# EasyEDA Pro project satelitesbol.eprj, board PCB6
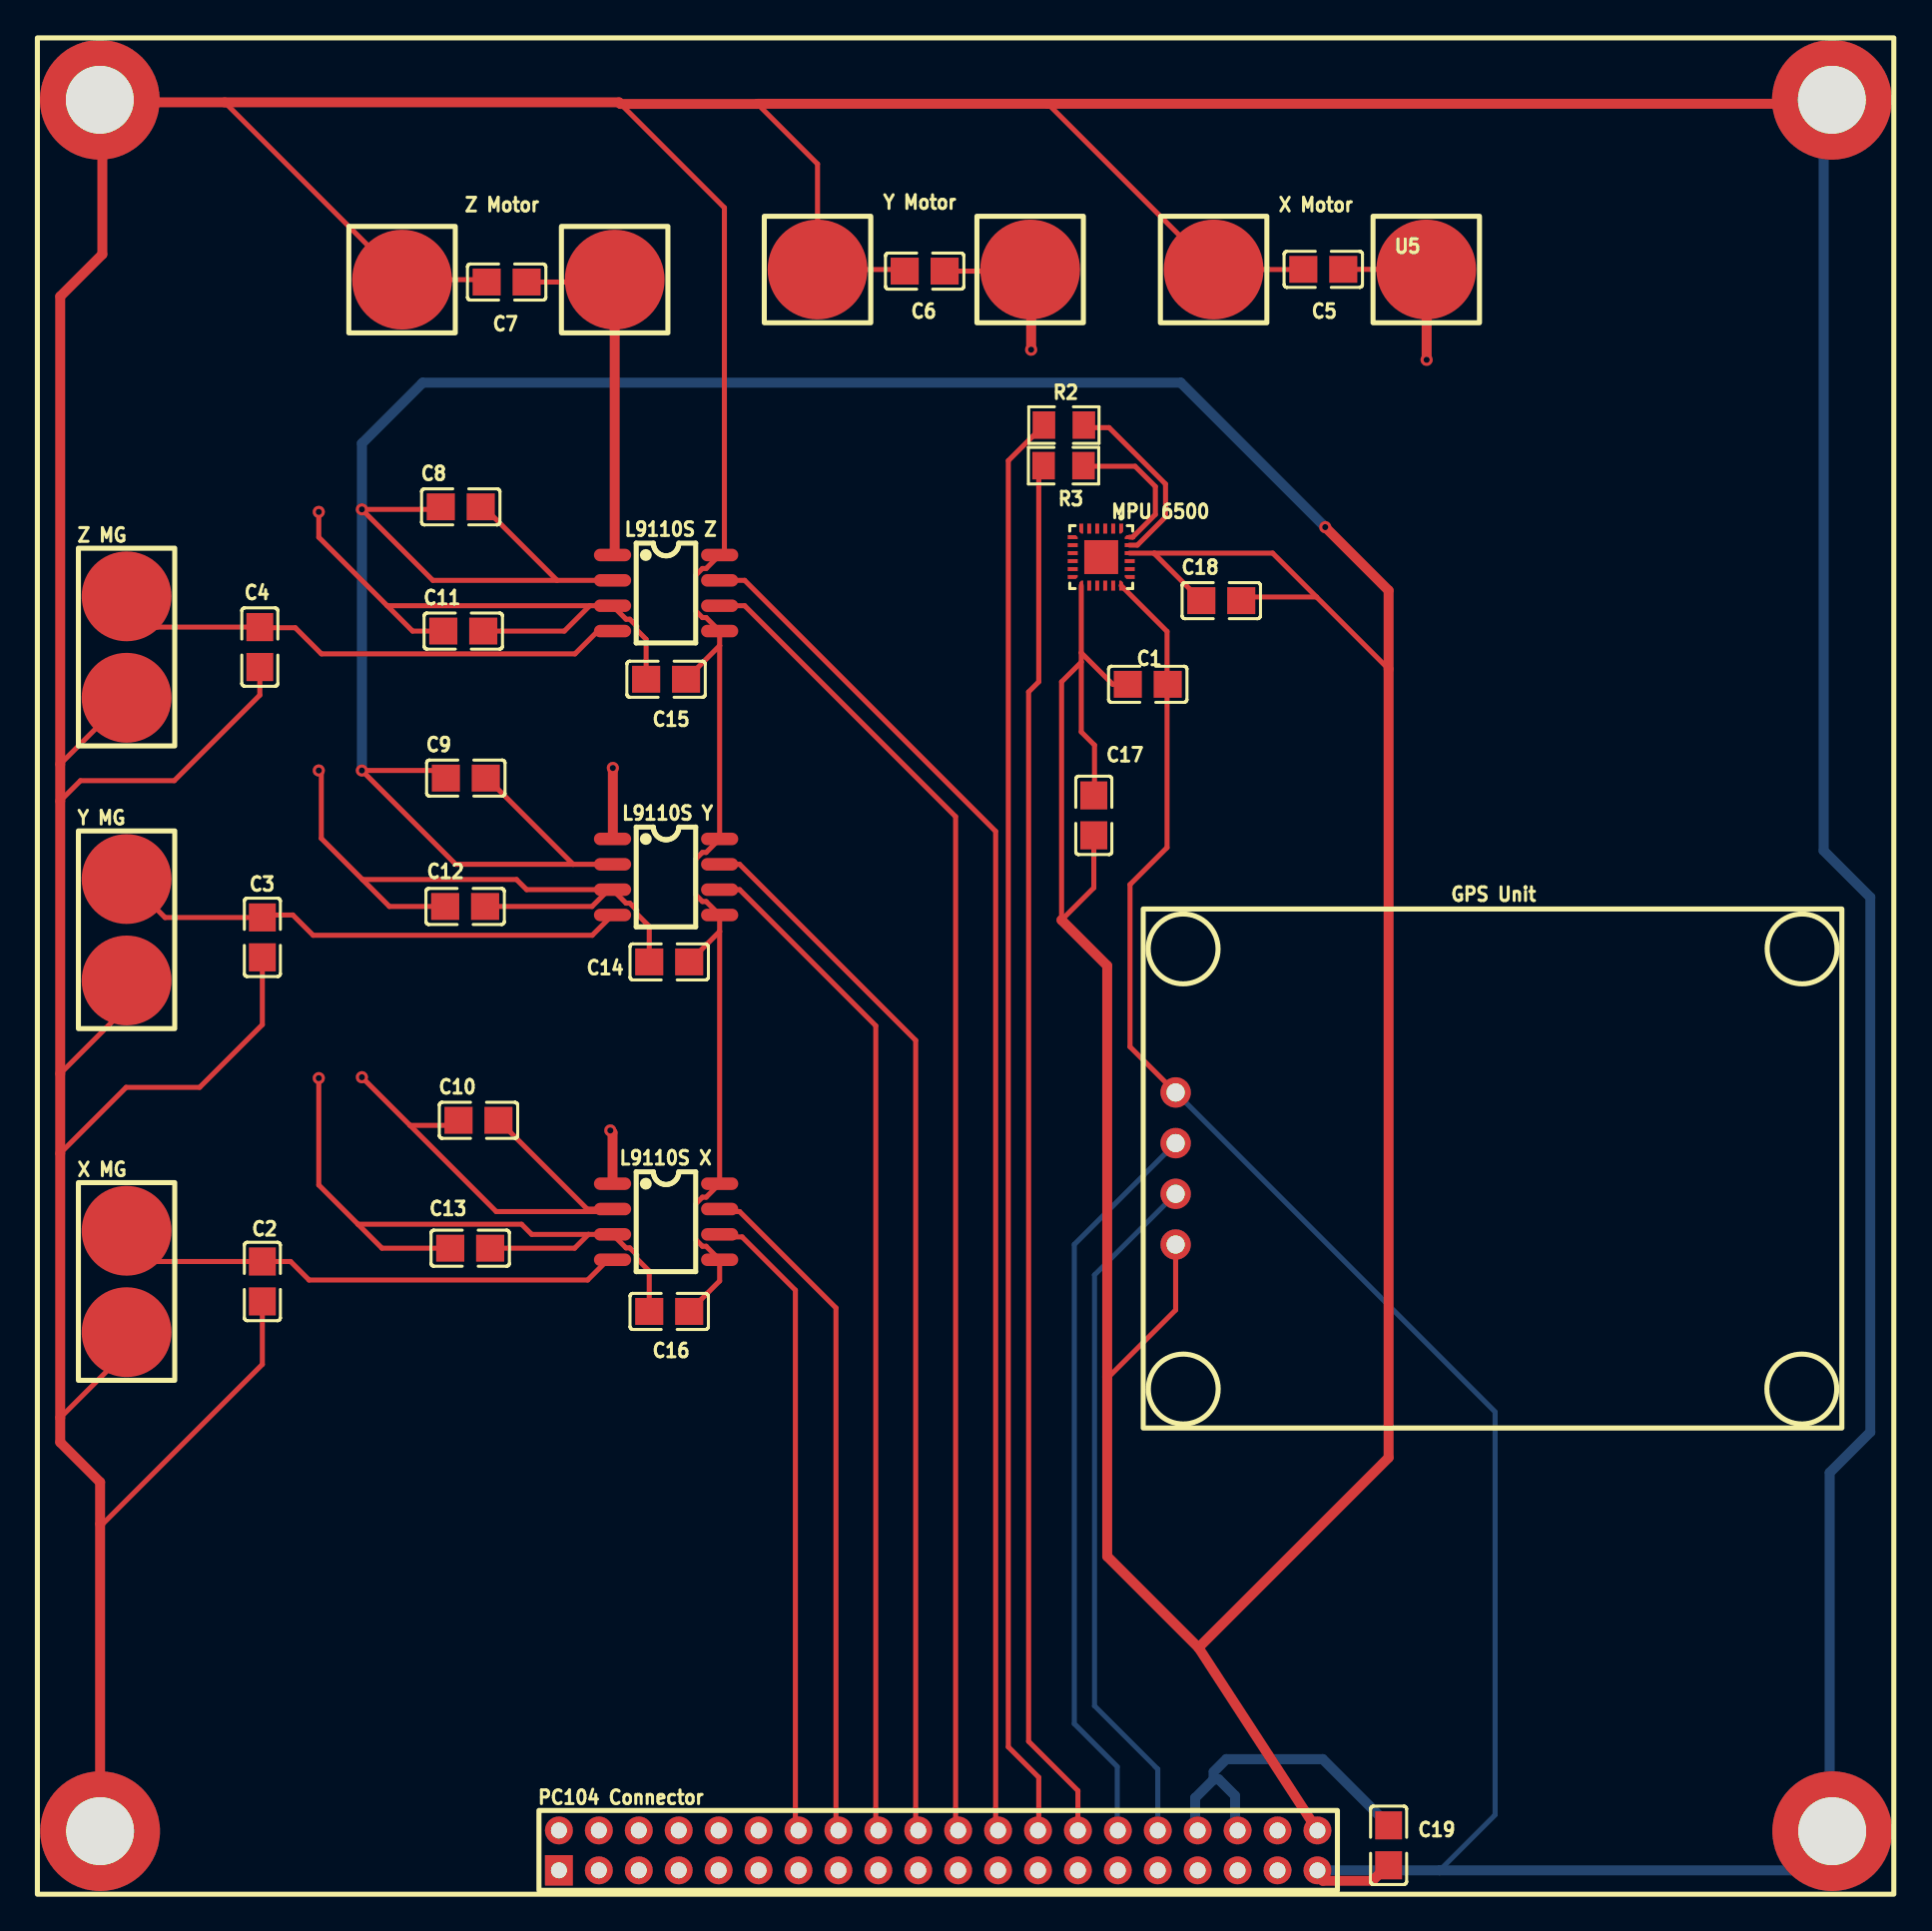
[diagram p6: board, top side]
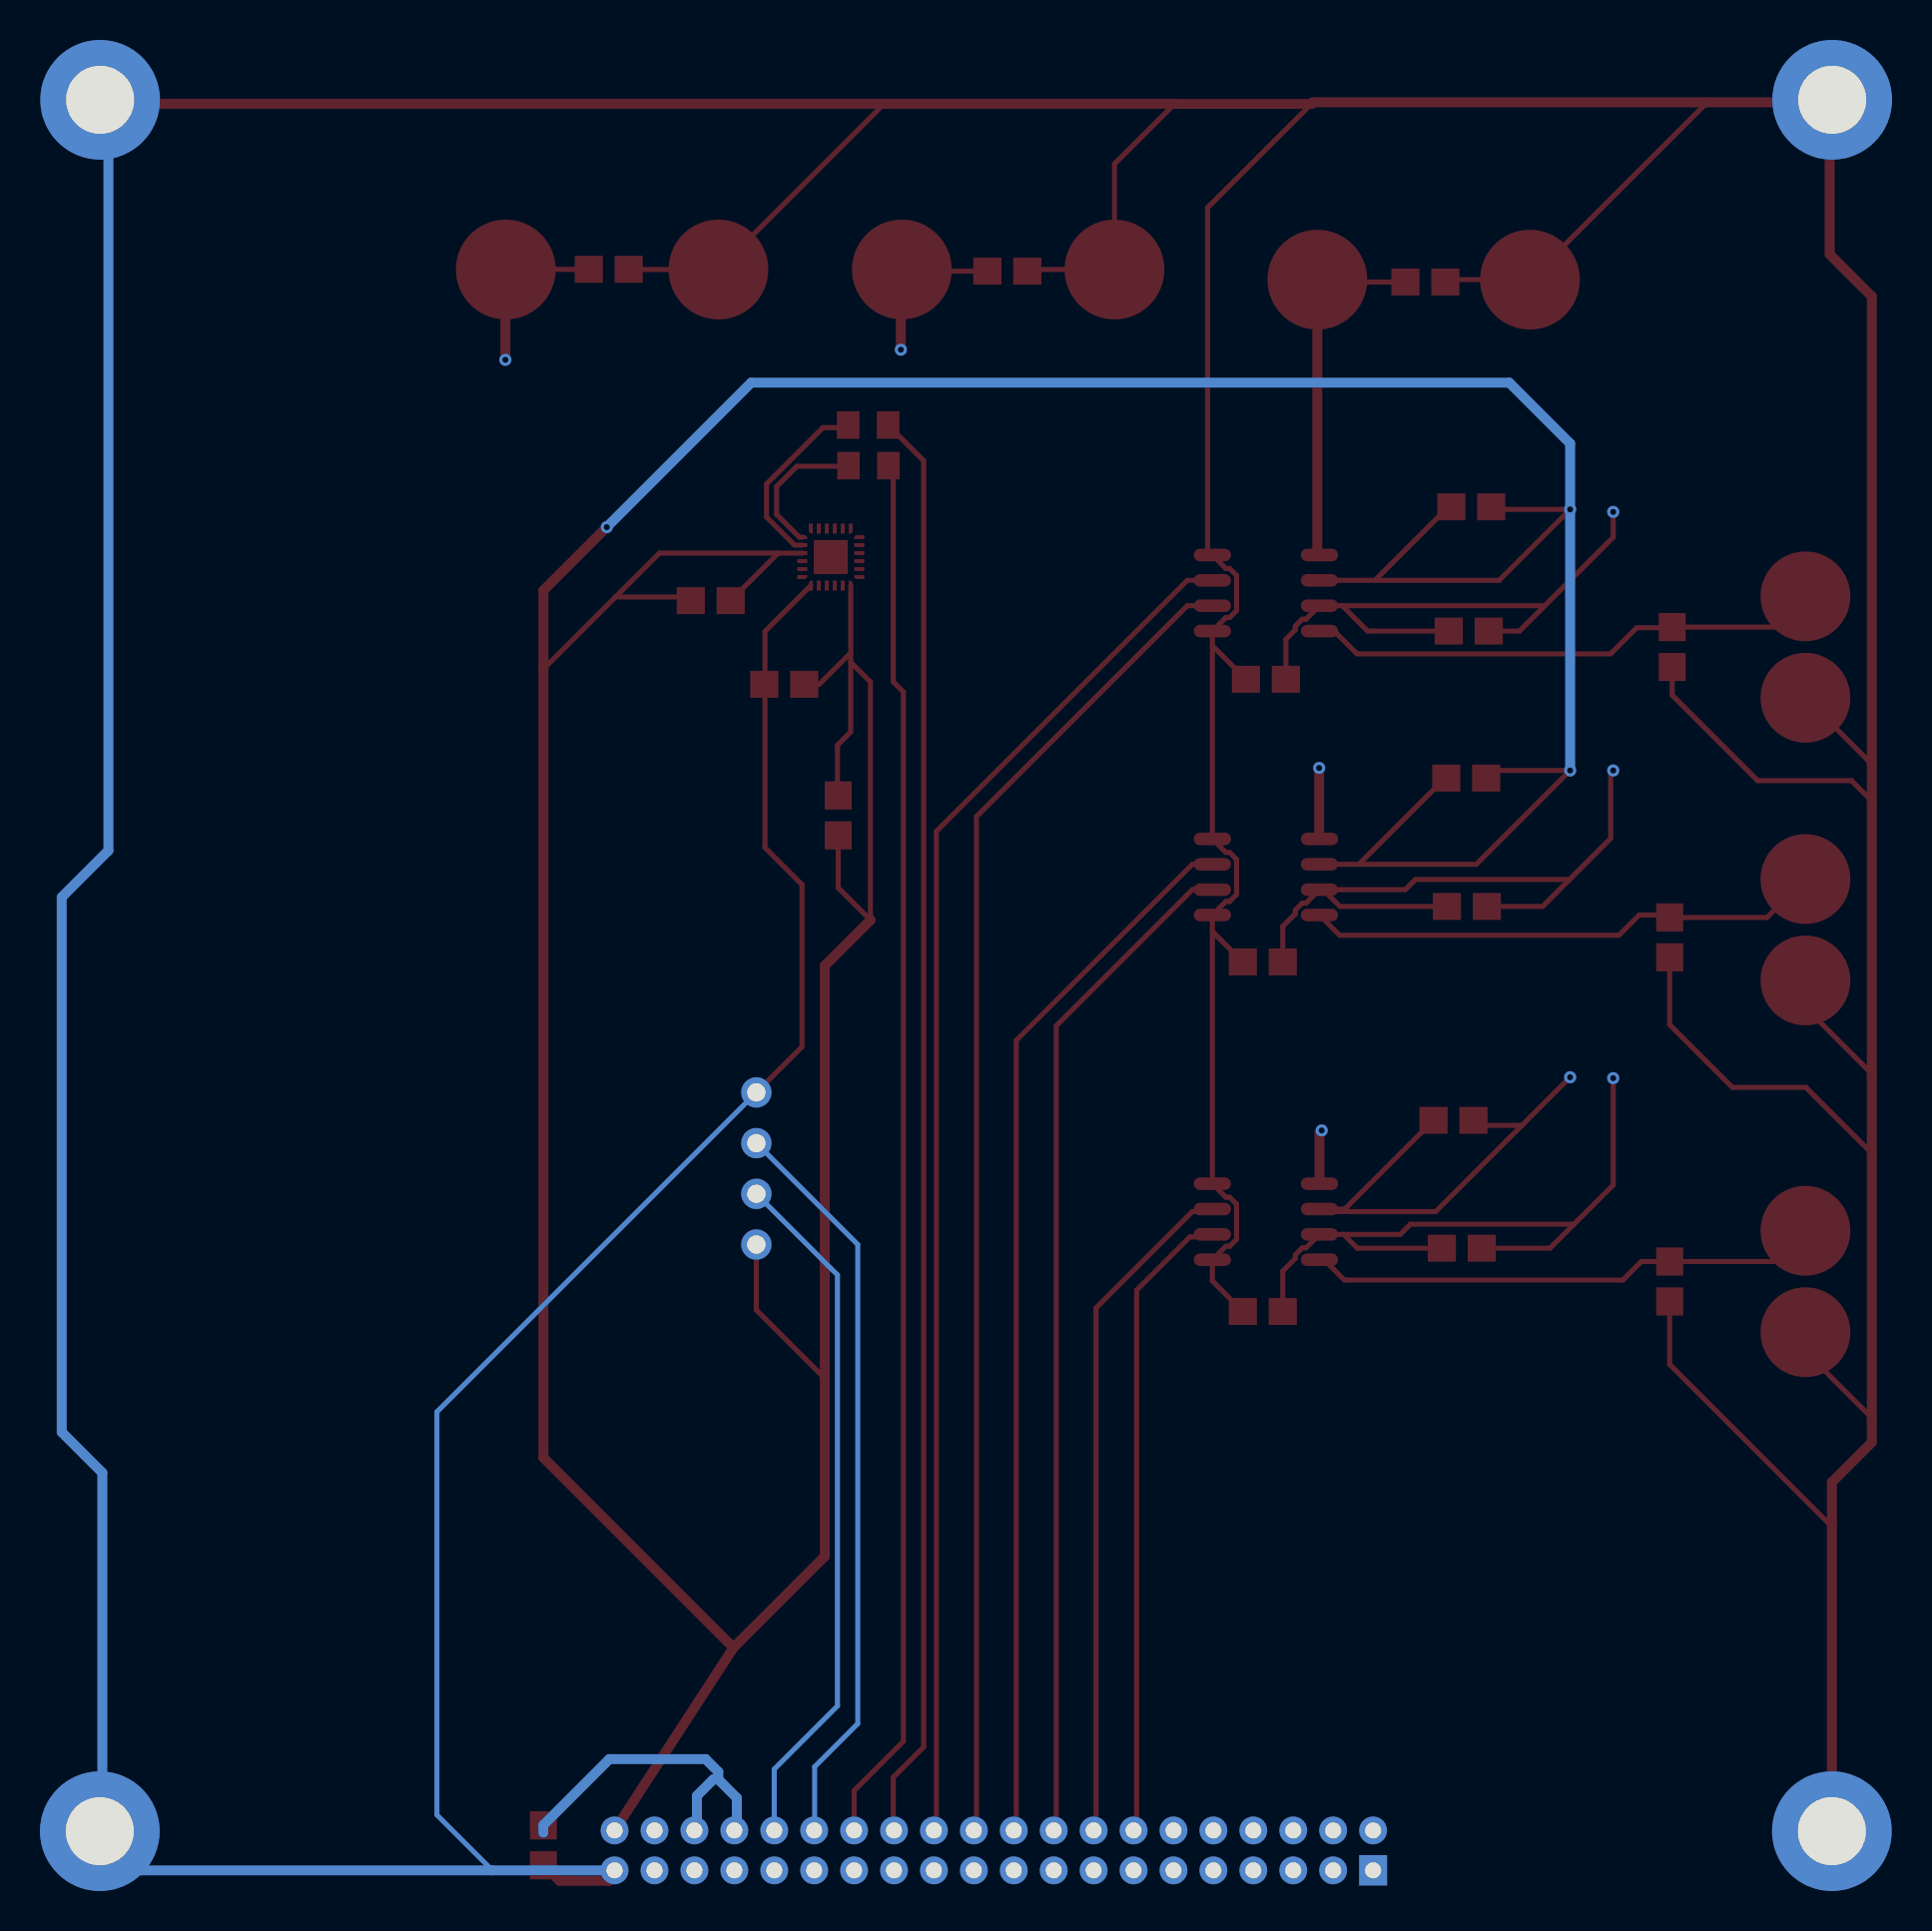
[diagram p7: board, bottom side, seen from below]

No outline. copper layers: Top Layer, Inner1, Inner2, Bottom Layer. Coordinates in mm from the lowest, leftmost part position.
Stack: Top Layer 0.035mm Outer layer thickness 1oz / Dielectric1 0.2104mm 7628 RC49% 8.6mil / Inner1 0.0152mm Inner layer thickness / Dielectric2 1.065mm 1.1mm H/HOZ Copper / Inner2 0.0152mm Inner layer thickness / Dielectric3 0.2104mm 7628 RC49% 8.6mil / Bottom Layer 0.035mm Outer layer thickness 1oz

## Design rules (mm)
template: JLCPCB Capability(Two Layers Board)
spacing copperThickness1oz (default): track to track 0.102, other pairs 0.152 to 0.3
spacing copperThickness2oz: track to track 0.203, other pairs 0.152 to 0.3
track width copperThickness1oz (default): min 0.127, default 0.254, max 2.54
track width copperThickness2oz: min 0.203, default 0.254, max 2.54
differential pair differentialPair (default): width min 0.127, default 0.254, max 2.54; gap min 0.152, default 0.152
via viaSize (default): diameter min 0.5, default 0.61, max 10; hole min 0.3, default 0.305, max 6.3

## Placement (name value [footprint] x y rotation side)
C1  100 µF  [C0805]  52.5 58.42 180 top
C2  0.1 µF  [C0805]  8.14 28.5 270 top
C3  0.1 µF  [C0805]  8.14 45.74 270 top
C4  0.1 µF  [C0805]  8.02 60.29 270 top
C5  0.1 µF  [C0805]  61.29 79.21 0 top
C6  0.1 µF  [C0805]  41.32 79.12 0 top
C7  0.1 µF  [C0805]  20.38 78.57 0 top
C8  0.1 µF  [C0805]  18.08 67.31 0 top
C9  0.1 µF  [C0805]  18.34 53.72 0 top
C10  0.1 µF  [C0805]  18.97 36.58 0 top
C11  0.1 µF  [C0805]  18.21 61.09 0 top
C12  0.1 µF  [C0805]  18.3 47.29 0 top
C13  0.1 µF  [C0805]  18.56 30.17 0 top
C14  100 µF  [C0805]  28.53 44.51 0 top
C15  100 µF  [C0805]  28.37 58.67 0 top
C16  100 µF  [C0805]  28.53 27 0 top
C17  0.1 µF  [C0805]  49.8 51.85 90 top
C18  0.1 µF  [C0805]  56.18 62.61 0 top
C19  1000 µF  [C0805]  64.56 0.25 90 top
GPS Unit  GY-NEO6MV2  [NEO-6M-V2]  69.77 34.16 90 top
L9110S X  L9110S Z-azis  [SOP-8_L4.9-W3.9-P1.27-LS6.0-BL]  28.37 31.5 270 top
L9110S Y  L9110S Y-axis  [SOP-8_L4.9-W3.9-P1.27-LS6.0-BL]  28.37 48.77 270 top
L9110S Z  L9110S X-axis  [SOP-8_L4.9-W3.9-P1.27-LS6.0-BL]  28.37 62.99 270 top
MPU 6500  MPU-6500  [QFN-24_L3.0-W3.0-P0.40-BL-EP]  50.17 64.79 180 top
PC104 Connector  TW-20-03-G-D-315-120  [HDR-TH_40P-P2.00-V-M-R2-C20-S2.00-1]  42 0 0 top
R2  10K  [R0805]  48.3 71.41 180 top
R3  10K  [R0805]  48.28 69.37 180 top
U5  -  [MOH]  25.79 78.69 0 top
U7  -  [MOH]  46.61 79.2 0 top
U9  -  [MOH]  66.45 79.2 0 top
U21  -  [M_H]  0 87.7 0 top
U22  -  [M_H]  0.02 0.96 0 top
U23  -  [M_H]  86.79 0.96 0 top
U24  -  [M_H]  86.77 87.7 0 top
X MG  -  [MG]  1.34 28.5 0 top
X Motor  -  [MOH]  55.8 79.2 0 top
Y MG  -  [MG]  1.34 46.12 0 top
Y Motor  -  [MOH]  35.96 79.2 0 top
Z MG  -  [MG]  1.34 60.29 0 top
Z Motor  -  [MOH]  15.14 78.69 0 top

## Footprints (pads in the part's own frame, mm; a bottom-side part is the same pattern mirrored in y, then rotated)
C0805
  rect 1.41x1.35 smd: 1(-1,0) 2(1,0)
HDR-TH_40P-P2.00-V-M-R2-C20-S2.00-1
  rect 1.4x1.524 hole 0.8: 1(-19,-1)
  round 1.4 hole 0.8: 2(-19,1) 3(-17,-1) 4(-17,1) 5(-15,-1) 6(-15,1) 7(-13,-1) 8(-13,1) 9(-11,-1) 10(-11,1) 11(-9,-1) 12(-9,1) 13(-7,-1) 14(-7,1) 15(-5,-1) 16(-5,1) 17(-3,-1) 18(-3,1) 19(-1,-1) 20(-1,1) 21(1,-1) 22(1,1) 23(3,-1) 24(3,1) 25(5,-1) 26(5,1) 27(7,-1) 28(7,1) 29(9,-1) 30(9,1) 31(11,-1) 32(11,1) 33(13,-1) 34(13,1) 35(15,-1) 36(15,1) 37(17,-1) 38(17,1) 39(19,-1) 40(19,1)
M_H
  round 6 hole 3.4: 1(0,0)
MG
  round 4.5 smd: 1(0,2.54) 2(0,-2.54)
MOH
  round 5 smd: 1(0,0)
NEO-6M-V2
  round 1.524 hole 0.914: 1(3.81,15.875) 2(1.27,15.875) 3(-1.27,15.875) 4(-3.81,15.875)
QFN-24_L3.0-W3.0-P0.40-BL-EP
  custom 0.2x0.506 smd: 1(-1,-1.427) 6(1,-1.427) 13(1,1.427) 18(-1,1.427)
  rect 0.2x0.505 smd: 2(-0.6,-1.427) 3(-0.2,-1.427) 4(0.2,-1.427) 5(0.6,-1.427) 14(0.6,1.427) 15(0.2,1.427) 16(-0.2,1.427) 17(-0.6,1.427)
  custom 0.506x0.2 smd: 7(1.427,-1) 12(1.427,1) 19(-1.427,1) 24(-1.427,-1)
  rect 0.505x0.2 smd: 8(1.427,-0.6) 9(1.427,-0.2) 10(1.427,0.2) 11(1.427,0.6) 20(-1.427,0.6) 21(-1.427,0.2) 22(-1.427,-0.2) 23(-1.427,-0.6)
  rect 1.7x1.7 smd: 25(0,0)
R0805
  rect 1.133x1.377 smd: 1(-1,0) 2(1,0)
SOP-8_L4.9-W3.9-P1.27-LS6.0-BL
  oval 0.63x1.865 smd: 1(-1.905,-2.683) 2(-0.635,-2.683) 3(0.635,-2.683) 4(1.905,-2.683) 5(1.905,2.683) 6(0.635,2.683) 7(-0.635,2.683) 8(-1.905,2.683)

## Nets
GND: C1.1 C2.2 C3.2 C4.2 C5.1 C6.1 C7.1 C14.2 C15.2 C16.2 C19.1 GPS Unit.1 L9110S X.5 L9110S X.8 L9110S Y.5 L9110S Y.8 L9110S Z.5 L9110S Z.8 MPU 6500.18 PC104 Connector.39 U21.1 U22.1 U23.1 U24.1 X MG.2 X Motor.1 Y MG.2 Y Motor.1 Z MG.2 Z Motor.1
3.3_VIN: C1.2 C8.1 C8.2 C9.1 C9.2 C10.1 C10.2 C17.1 C17.2 C18.1 C18.2 GPS Unit.4 L9110S X.2 L9110S Y.2 L9110S Z.2 MPU 6500.13 MPU 6500.22 PC104 Connector.38 PC104 Connector.40
5_VIN: C11.1 C11.2 C12.1 C12.2 C13.1 C13.2 C14.1 C15.1 C16.1 C19.2 L9110S X.3 L9110S Y.3 L9110S Z.3 PC104 Connector.34 PC104 Connector.36
$1N1283: C7.2 L9110S Z.1 U5.1
$1N1297: C6.2 L9110S Y.1 U7.1
$1N1344: C5.2 L9110S X.1 U9.1
$1N1402: L9110S X.6 PC104 Connector.14
$1N1409: L9110S X.7 PC104 Connector.16
$1N1417: L9110S Y.6 PC104 Connector.18
$1N1425: L9110S Y.7 PC104 Connector.20
$1N1433: L9110S Z.6 PC104 Connector.22
$1N1447: L9110S Z.7 PC104 Connector.24
$1N1695: C4.1 L9110S Z.4 Z MG.1
$1N1701: C3.1 L9110S Y.4 Y MG.1
$1N1708: C2.1 L9110S X.4 X MG.1
$1N1962: GPS Unit.2 PC104 Connector.30
$1N1967: GPS Unit.3 PC104 Connector.32
$1N2074: MPU 6500.23 R2.1
$1N2079: PC104 Connector.26 R2.2
$1N6098: MPU 6500.24 R3.1
$1N6105: PC104 Connector.28 R3.2

Pads without a net: MPU 6500 1 2 3 4 5 6 7 8 9 10 11 12 14 15 16 17 19 20 21 25; PC104 Connector 1 2 3 4 5 6 7 8 9 10 11 12 13 15 17 19 21 23 25 27 29 31 33 35 37

## Via types
v1: diameter 0.61, hole 0.305, Top Layer to Bottom Layer, 11 vias

## Routing (per net, layer and track width the routed paths; a pad name or vN(x,y) marks a point on that pad's centre or on a via; arc(x,y) is an arc through that point)
GND: length 549.2
  Top Layer w0.254: GPS Unit.1 51.61,40.26 51.61,48.39 53.47,50.24 53.47,61.07 MPU 6500.18 ; C15.2 31.05,60.36 ; 31.05,60.36 L9110S Z.5 30.38,61.76 30.19,61.76 29.84,62.11 29.84,63.87 30.19,64.22 30.38,64.22 L9110S Z.8 31.29,65.14 31.29,82.3 26.09,87.5 ; 31.05,60.36 L9110S Y.8 30.38,50 30.19,50 29.84,49.65 29.84,47.89 30.19,47.54 30.38,47.54 L9110S Y.5 31.05,46.04 ; -1.98,38.91 1.34,42.24 Y MG.2 ; C16.2 31.05,28.53 L9110S X.5 30.38,30.27 30.19,30.27 29.84,30.62 29.84,32.38 30.19,32.72 30.38,32.72 L9110S X.8 31.05,46.04 ; -1.98,52.58 -0.97,53.59 3.73,53.59 8.02,57.88 8.02,59.32 ; 32.94,87.5 35.96,84.49 Y Motor.1 40.28,79.2 40.36,79.12 ; 19.42,78.57 19.3,78.69 Z Motor.1 6.26,87.58 ; 8.14,45.16 8.14,41.37 5,38.23 1.32,38.23 -1.98,34.93 ; Z MG.2 -1.98,54.42 ; 31.05,46.04 C14.2 ; 60.33,79.21 60.32,79.2 X Motor.1 47.5,87.5 ; 8.14,27.54 8.14,24.35 0.14,16.35 0.02,16.35 ; 8.02,59.7 7.85,59.53 ; X MG.2 1.34,25 -1.98,21.67
  Top Layer w0.5: 86.64,87.58 86.57,87.5 32.94,87.5 32.93,87.5 26.09,87.5 26.01,87.58 0.13,87.58 0.13,79.96 -1.98,77.85 -1.98,20.45 0.02,18.45 U22.1 ; 64.56,-0.71 63.75,-1.52 61.27,-1.52 60.87,-1.13
  Bottom Layer w0.254: GPS Unit.1 69.9,21.97 69.9,1.78 67.12,-1
  Bottom Layer w0.5: 86.64,87.58 86.36,87.29 86.36,50.09 88.69,47.75 88.69,20.96 86.66,18.92 86.66,0.96 84.7,-1 PC104 Connector.39
3.3_VIN: length 408.2
  Top Layer w0.254: 15.54,36.32 19.86,32 25.69,32 ; 15.54,36.32 v1(13.13,38.74) ; 15.54,36.32 17.72,36.32 C10.1 ; C8.2 19.23,67.31 22.91,63.63 ; 60.95,62.8 58.75,64.99 52.84,64.99 ; 60.95,62.8 57.37,62.8 C18.2 ; 60.95,62.8 64.56,59.18 ; C9.2 19.39,53.72 23.71,49.4 ; 23.71,49.4 17.83,49.4 v1(13.13,54.1) 16.96,54.1 C9.1 ; 23.71,49.4 L9110S Y.2 ; 49.17,59.53 49.17,60 ; 49.17,59.53 48.18,58.54 48.18,46.61 49.8,48.23 49.8,50.89 ; 49.17,59.53 49.17,56.04 49.83,55.37 49.83,52.86 49.8,52.82 ; 49.17,60 50.75,58.42 51.23,58.42 ; 49.17,60 MPU 6500.13 ; C10.2 24.42,32.13 L9110S X.2 ; 52.84,64.99 52.84,64.96 C18.1 ; 52.84,64.99 51.59,64.99 ; 22.91,63.63 L9110S Z.2 ; 22.91,63.63 16.69,63.63 v1(13.13,67.18) 16.96,67.18 C8.1 ; 50.47,23.71 50.53,23.71 53.9,27.08 GPS Unit.4
  Top Layer w0.5: v1(61.39,66.29) 64.56,63.12 64.56,19.68 55.04,10.16 ; 48.18,46.61 48.18,46.61 50.47,44.32 50.47,14.73 55.04,10.16 ; 60.88,0.88 60.87,0.87 ; 55.04,10.16 PC104 Connector.40
  Inner1 w0.254: v1(13.13,38.74) 13.26,15.24 20.11,8 53.77,8.13 56.82,4.7 PC104 Connector.38
  Inner2 w0.254: v1(13.13,54.1) v1(13.13,38.74)
  Bottom Layer w0.254: 13,67.18 13.07,67.12
  Bottom Layer w0.5: 13.13,67.06 v1(13.13,54.1) ; v1(61.39,66.29) 54.15,73.53 16.18,73.53 13.13,70.49 v1(13.13,67.18)
5_VIN: length 222.7
  Top Layer w0.254: 13.16,48.64 20.88,48.64 21.38,48.13 25.5,48.13 24.66,47.29 C12.2 ; 13.16,48.64 14.51,47.29 C12.1 ; 13.16,48.64 11.1,50.7 11.1,54.1 ; 12.94,31.37 10.97,33.34 10.97,38.61 ; 12.94,31.37 14.14,30.17 C13.1 ; 12.94,31.37 21.13,31.37 21.64,30.86 24.48,30.86 ; C16.1 27.53,29.02 26.9,29.65 26.9,29.84 26.55,30.19 26.36,30.19 L9110S X.3 24.48,30.86 ; C11.1 15.67,61.09 14.4,62.36 ; 24.48,30.86 23.79,30.17 C13.2 ; 24.54,62.36 L9110S Z.3 26.36,61.68 26.55,61.68 26.9,61.33 26.9,61.15 27.37,60.67 C15.1 ; 24.54,62.36 14.4,62.36 ; 24.54,62.36 23.27,61.09 C11.2 ; 14.4,62.36 10.97,65.79 v1(10.97,67.06) ; C14.1 27.53,46.29 26.9,46.92 26.9,47.11 26.55,47.46 26.36,47.46 L9110S Y.3
  Inner1 w0.254: v1(10.97,54.1) 10.97,65.79
  Inner1 w0.5: v1(10.97,54.1) v1(10.97,38.69) 10.97,13.72 19.23,5.46 54.15,5.46 55,4.61 PC104 Connector.34
  Bottom Layer w0.5: 55.8,3.56 56.06,3.56 56.87,2.74 56.87,0.87 ; 55.8,3.56 55.8,3.94 56.44,4.57 61.26,4.57 64.56,1.27 64.56,0.89 ; 55.8,3.56 54.87,2.63 54.87,0.87
$1N1283: length 18.2
  Top Layer w0.254: 21.35,78.57 25.67,78.57
  Top Layer w0.5: L9110S Z.1 25.79,65 U5.1
$1N1297: length 41.6
  Top Layer w0.254: 42.29,79.12 46.53,79.12 U7.1
  Top Layer w0.5: U7.1 46.66,79.15 v1(46.66,75.18) ; L9110S Y.1 25.7,50.69 25.7,54.1
  Inner2 w0.5: v1(46.66,75.18) v1(25.7,54.23) 25.7,54.1
$1N1344: length 68.3
  Top Layer w0.254: C5.2 66.44,79.21
  Top Layer w0.5: v1(25.58,36.07) 25.69,35.96 L9110S X.1 ; U9.1 66.47,79.18 v1(66.47,74.68)
  Inner2 w0.5: v1(25.58,36.07) 25.7,36.19 26.34,36.19 30.4,40.26 32.05,40.26 v1(66.47,74.68)
$1N1402: length 32.1
  Top Layer w0.254: 34.87,0.87 34.85,0.9 34.85,28.07 32.18,30.73 31.05,30.73
$1N1409: length 34.1
  Top Layer w0.254: 31.05,32 32.05,32 36.88,27.18 36.88,0.88 36.87,0.87
$1N1417: length 51.1
  Top Layer w0.254: L9110S Y.6 32.05,48.13 38.87,41.31 38.87,0.87
$1N1425: length 53.2
  Top Layer w0.254: L9110S Y.7 32.05,49.4 40.87,40.58 40.87,0.87
$1N1433: length 67.1
  Top Layer w0.254: L9110S Z.6 32.31,62.36 42.87,51.79 42.87,0.87
$1N1447: length 69.2
  Top Layer w0.254: 44.87,0.87 44.88,0.88 44.88,51.05 32.31,63.63 L9110S Z.7
$1N1695: length 25.8
  Top Layer w0.254: Z MG.1 2.88,61.29 C4.1 ; 8.02,61.25 9.8,61.25 11.1,59.94 23.8,59.94 25.07,61.21 25.43,61.21
$1N1701: length 26.2
  Top Layer w0.254: Y MG.1 3.27,46.74 7.76,46.74 ; 7.76,46.36 C3.1 ; 8.14,46.71 8.37,46.48 ; L9110S Y.4 24.67,45.85 10.69,45.85 9.67,46.86 8.37,46.86
$1N1708: length 25.7
  Top Layer w0.254: X MG.1 2.88,29.5 C2.1 9.56,29.5 10.48,28.58 24.44,28.58 25.33,29.46 25.69,29.46
$1N1962: length 37.4
  Bottom Layer w0.254: GPS Unit.2 48.82,30.35 48.82,6.35 50.98,4.19 50.98,1.03 PC104 Connector.30
$1N1967: length 34.9
  Bottom Layer w0.254: PC104 Connector.32 53,4.07 49.83,7.24 49.83,28.83 GPS Unit.3
$1N2074: length 9.3
  Top Layer w0.254: 51.59,65.39 51.98,65.39 53.39,66.8 53.39,68.45 50.56,71.28 49.42,71.28 R2.1
$1N2079: length 72
  Top Layer w0.254: 46.87,0.87 47.04,1.04 47.04,3.66 45.51,5.18 45.51,69.62 R2.2
$1N6098: length 7.3
  Top Layer w0.254: 49.38,69.47 R3.1 49.31,69.34 51.86,69.34 52.88,68.33 52.88,66.93 51.74,65.79 51.59,65.79
$1N6105: length 69.7
  Top Layer w0.254: R3.2 47.04,69.13 47.04,58.55 46.53,58.04 46.53,5.46 49,2.99 PC104 Connector.28
